# EAGLE board kicker (EAGLE 9.2.2)
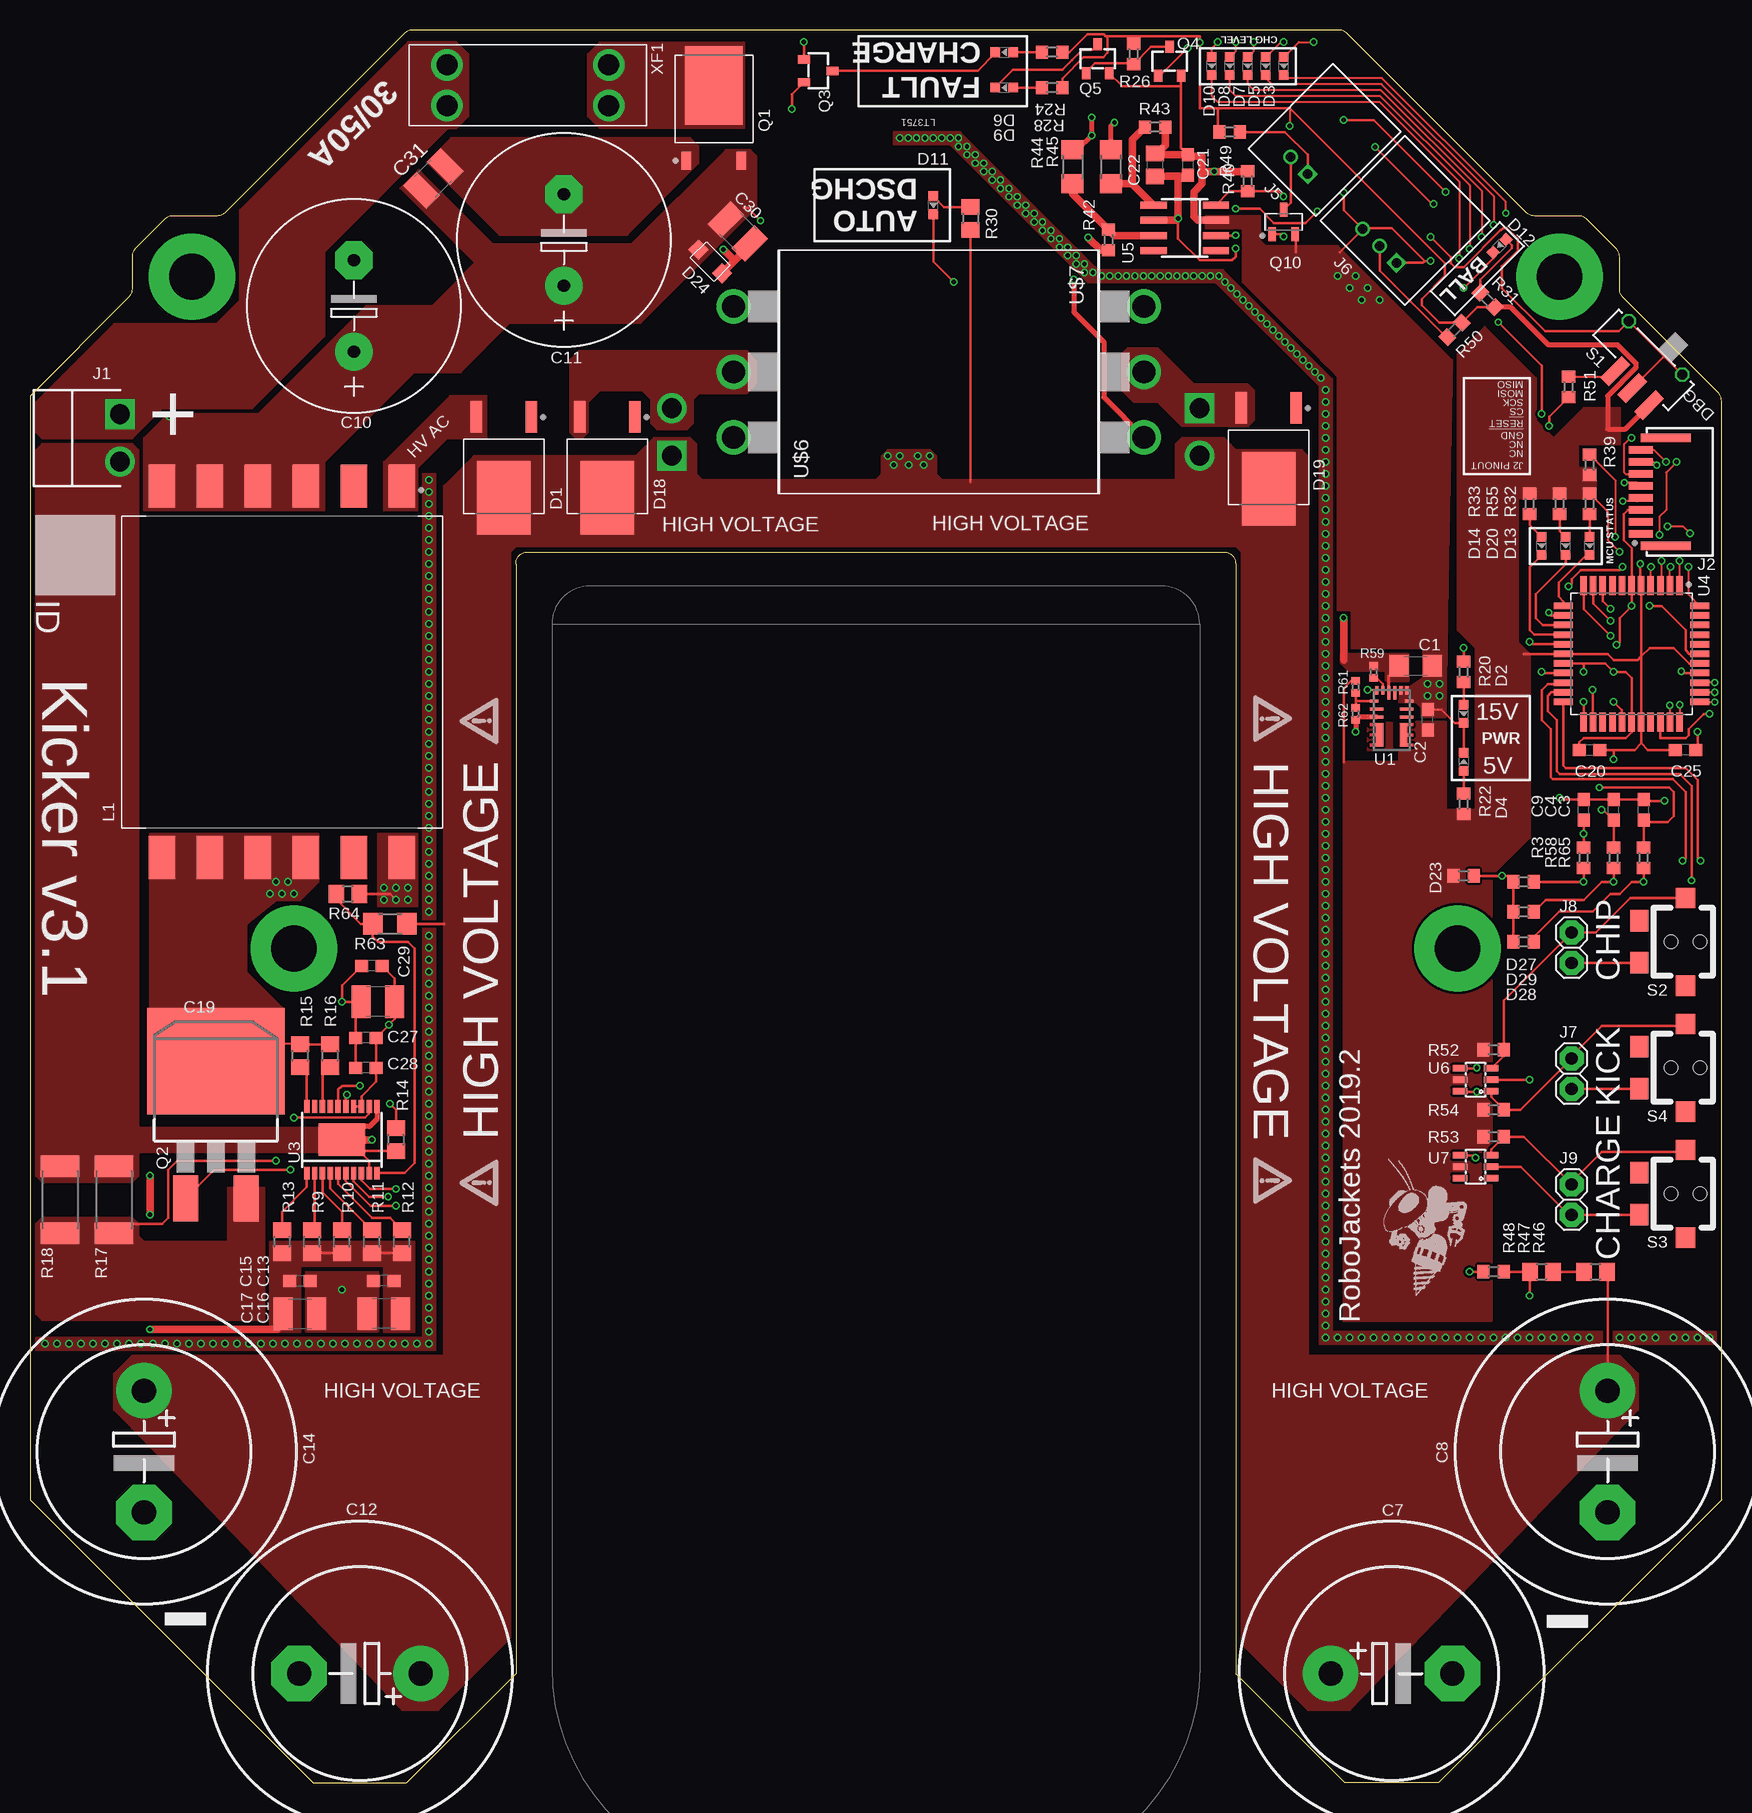
[diagram p9: board, top side]
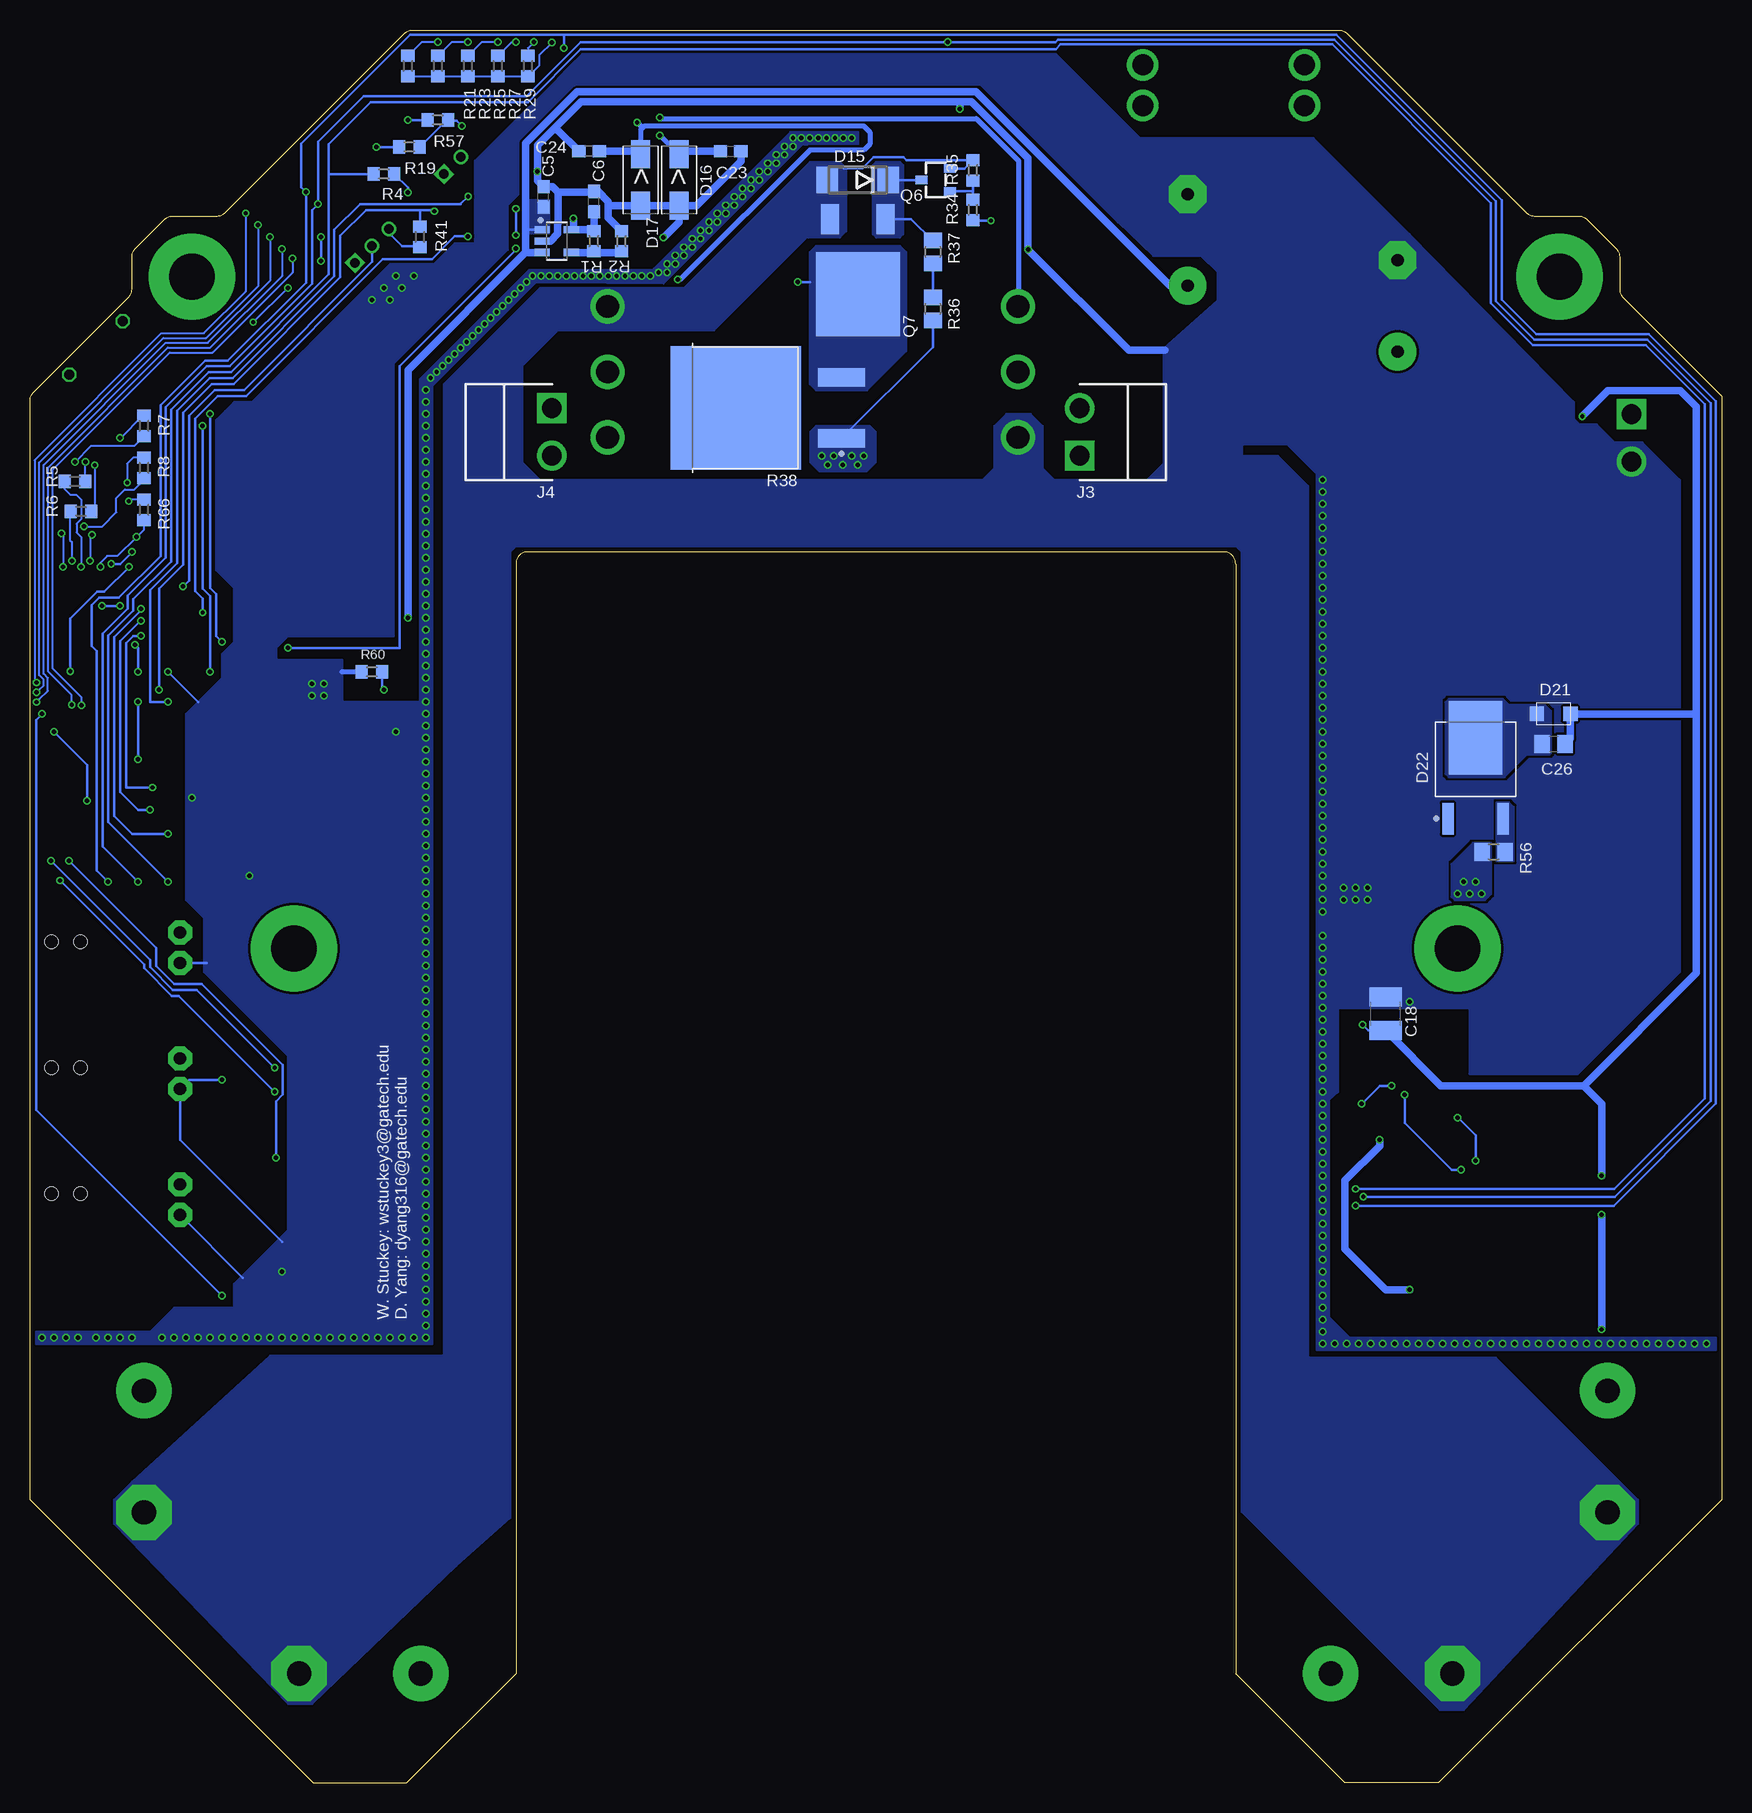
[diagram p10: board, bottom side, seen from below]

Size 141 x 146.1 mm. Coordinates in mm from the lower left corner, seen from the top.
Outline: 40.5,101.6 arc-90 41.5,102.6 99.5,102.6 arc-90 100.5,101.6 100.5,9.1 109.6,0 117.4,0 141,23.6 141,115.19 arc45 140.71,115.89 132.79,123.81 arc-45 132.5,124.51 132.5,127.19 arc45 132.21,127.89 129.79,130.31 arc45 129.09,130.6 125.41,130.6 arc-45 124.71,130.89 109.79,145.81 arc45 109.09,146.1 31.91,146.1 arc45 31.21,145.81 16.29,130.89 arc-45 15.59,130.6 11.91,130.6 arc45 11.21,130.31 8.79,127.89 arc45 8.5,127.19 8.5,124.51 arc-45 8.21,123.81 0,115.6 0,23.6 23.6,0 31.4,0 40.5,9.1 40.5,101.6
Copper layers (1*16): Top 0.018mm / dielectric 1.55mm / Bottom 0.018mm
Design rules "eC_2Layer_PClass6_BaseCopperO18_eCDefault": minimum track width 0.15mm, minimum drill 0.35mm, track to track 0.15mm, track to pad 0.15mm, pad to pad 0.15mm, via to via 0.15mm, smd to smd 0mil, copper to edge 0.25mm, drill to drill 0.35mm, minimum pad ring 0.175mm, minimum via ring 0.125mm, stop-mask expansion 0mil, vias tented up to drill 0.45mm, thermal gap 0.2mm
Net classes: 0 default: clearance 0.205 mm
vRestrict: area 18.2,65.8 to 25.8,73.3; area 115.2,65.8 to 122.8,73.3; area 9.8,121.8 to 17.2,129.3; area 123.8,121.8 to 131.2,129.3

## Footprints (pad centres in the part's own frame; a part is rotated, then mirrored left to right if it is on the bottom)
C1206 = smd 1.6 x 1.8: 1 -1.4,0; 2 1.4,0
C0603 = smd 1.1 x 1: 1 -0.85,0; 2 0.85,0
EB25D = drill 2.007 pad 4.597: + -5.08,0 | drill 2.007 pad 4.597 octagon: - 5.08,0
E7,5-18 = drill 1.016 pad 3.15: + -3.81,0 | drill 1.016 pad 3.15 octagon: - 3.81,0
C1210 = smd 1.6 x 2.7: 1 -1.4,0; 2 1.4,0
C0805 = smd 1.3 x 1.5: 1 -0.95,0; 2 0.95,0
TO460P990X239-3 = smd 2.634 x 0.974: 1 -4.241,2.3; 2 -4.241,-2.3 | smd 6.101 x 4.492: 3 2.507,0
CHIP-LED0603 = smd 0.8 x 0.8: A 0,-0.75; C 0,0.75
DO214AA = smd 1.8 x 2.2: A 2.55,0; C -2.55,0
RESM5226X262 = smd 2.316 x 1.565: 1 -2.141,0; 2 2.141,0
SOD123-W = smd 1.2 x 1.2: A 1.4,0; C -1.4,0
R0603 = smd 1 x 1.1: 1 -0.85,0; 2 0.85,0
B2PS-CENTERED = drill 1.65 square: 1 -1.98,0 | drill 1.65: 2 1.98,0
HFW8R-1ST = smd 0.6 x 2: 1 -3.5,3.25; 2 -2.5,3.25; 3 -1.5,3.25; 4 -0.5,3.25; 5 0.5,3.25; 6 1.5,3.25; 7 2.5,3.25; 8 3.5,3.25 | smd 0.7 x 4.2: LEG1 -4.5,1.15; LEG2 4.5,1.15
2MM-2-H = drill 0.8 square: 1 0,0 | drill 0.8: 2 2,0
2MM-3-H = drill 0.8 square: 1 -2,0 | drill 0.8: 2 0,0; 3 2,0
1X2 = drill 1.016 pad 2 octagon: 1 -1.27,0; 2 1.27,0
SOP400P3370X1400-12 = smd 3.562 x 2.172: 1 -15.475,10; 2 -15.475,6; 3 -15.475,2; 4 -15.475,-2; 5 -15.475,-6; 6 -15.475,-10; 7 15.475,-10; 8 15.475,-6; 9 15.475,-2; 10 15.475,2; 11 15.475,6; 12 15.475,10
TO460P950X150-3 = smd 1.512 x 0.772: 1 -4.4,2.3; 2 -4.4,-2.3 | smd 6.542 x 4.772: 3 1.885,0
D2PAK = smd 2.083 x 3.81: 1 -2.54,-8.89; 3 2.54,-8.89 | smd 11.43 x 8.89: 2 0,2.54
SOT-23-3 = smd 0.7 x 1: 1 -0.95,-1.2; 2 0.95,-1.2; 3 0,1.2
DPAK = smd 1.5 x 2.5: 1 -2.3,-6.25; 3 2.3,-6.25 | smd 7 x 7: FIN 0,0
SOT95P240X110-3 = smd 1.18 x 0.609: 1 -1.024,0.95; 2 -1.024,-0.95; 3 1.024,0
R0805 = smd 1.3 x 1.5: 1 -0.95,0; 2 0.95,0
R2512 = smd 1.8 x 3.2: 1 -2.8,0; 2 2.8,0
TO508P1539X450-3 = smd 3.912 x 1.572: 1 -6.145,2.54; 2 -6.145,-2.54 | smd 10.892 x 10.272: 3 2.655,0
R1206 = smd 1.6 x 1.803: 1 -1.422,0; 2 1.422,0
R0402 = smd 0.6 x 0.7: 1 -0.5,0; 2 0.5,0
CSS-121XB = smd 1 x 2.5: 1 -3,3.75; 2 -1,3.75; 3 1,3.75 | drill 0.8 pad 1.2 octagon: LEG1 -3.15,0; LEG4 3.15,0
HDP001R = smd 1.8 x 1.5: A -1.75,-3.85; B 1.75,-3.85 | smd 1.7 x 1.6: C -3.65,0; D 3.65,0 | hole 1.1: 0,1.2; 0,-1.2
MPM3620GQV-P = smd 0.7 x 0.25: 1 -1.45,1.55; 12 1.45,1.55 | smd 1.1 x 0.25: 2 -1.25,0.9; 3 -1.25,0.25; 10 1.25,0.25; 11 1.25,0.9 | smd 0.25 x 0.7: 13 1.25,2.45; 14 0.75,2.45; 17 -0.75,2.45; 18 -1.25,2.45 | smd 0.25 x 1.1: 15 0.25,2.25; 16 -0.25,2.25 | smd 0.6 x 1.95: 456 -1,-1.25; 789 1,-1.25
SOT95P280X145-5 = smd 1.259 x 0.609: 1 -1.228,0.95; 2 -1.228,0; 3 -1.228,-0.95; 4 1.228,-0.95; 5 1.228,0.95
TSSOP-20_EP = smd 1.05 x 0.45: 1 -2.775,2.925; 2 -2.775,2.275; 3 -2.775,1.625; 4 -2.775,0.975; 5 -2.775,0.325; 6 -2.775,-0.325; 7 -2.775,-0.975; 8 -2.775,-1.625; 9 -2.775,-2.275; 10 -2.775,-2.925; 11 2.775,-2.925; 12 2.775,-2.275; 13 2.775,-1.625; 14 2.775,-0.975; 15 2.775,-0.325; 16 2.775,0.325; 17 2.775,0.975; 18 2.775,1.625; 19 2.775,2.275; 20 2.775,2.925 | smd 2.74 x 3.86: PAD 0,0
QFP80P1200X1200X120-44 = smd 1.6 x 0.547: 1 -5.681,4; 2 -5.681,3.2; 3 -5.681,2.4; 4 -5.681,1.6; 5 -5.681,0.8; 6 -5.681,0; 7 -5.681,-0.8; 8 -5.681,-1.6; 9 -5.681,-2.4; 10 -5.681,-3.2; 11 -5.681,-4; 23 5.681,-4; 24 5.681,-3.2; 25 5.681,-2.4; 26 5.681,-1.6; 27 5.681,-0.8; 28 5.681,0; 29 5.681,0.8; 30 5.681,1.6; 31 5.681,2.4; 32 5.681,3.2; 33 5.681,4 | smd 0.547 x 1.6: 12 -4,-5.681; 13 -3.2,-5.681; 14 -2.4,-5.681; 15 -1.6,-5.681; 16 -0.8,-5.681; 17 0,-5.681; 18 0.8,-5.681; 19 1.6,-5.681; 20 2.4,-5.681; 21 3.2,-5.681; 22 4,-5.681; 34 4,5.681; 35 3.2,5.681; 36 2.4,5.681; 37 1.6,5.681; 38 0.8,5.681; 39 0,5.681; 40 -0.8,5.681; 41 -1.6,5.681; 42 -2.4,5.681; 43 -3.2,5.681; 44 -4,5.681
SOIC-8 = smd 0.6 x 2.2: 1 -1.905,-2.6; 2 -0.635,-2.6; 3 0.635,-2.6; 4 1.905,-2.6; 5 1.905,2.6; 6 0.635,2.6; 7 -0.635,2.6; 8 -1.905,2.6
SOT-23-6 = smd 0.55 x 1.2: 1 -0.95,-1.3; 2 0,-1.3; 3 0.95,-1.3; 4 0.95,1.3; 5 0,1.3; 6 -0.95,1.3
TO264 = drill 1.905: C_BOT 0,-6.35; E_BOT 5.461,-6.35; G_BOT -5.461,-6.35
3557-2 = drill 1.75: 1 -6.735,1.7; 2 -6.735,-1.7; 3 6.735,-1.7; 4 6.735,1.7

## Placement (x,y rotation side)
C1  10uF 50V  [C1206]  115.5,93.1 0 top
C2  22uF 10V  [C0603]  116.5,88.6 90 top
C3  1uF  [C0603]  134.5,81.1 90 top
C4  1uF  [C0603]  132,81.1 90 top
C5  1uF  [C0603]  98.2,132.2 90 bottom
C6  2.2uF  [C0603]  94,131.8 90 bottom
C7  1000uF  [EB25D]  113.5,9.1 0 top
C8  1000uF  [EB25D]  131.5,27.6 270 top
C9  1uF  [C0603]  129.5,81.1 90 top
C10  560uF  [E7,5-18]  27,123.1 90 top
C11  560uF  [E7,5-18]  44.5,128.6 90 top
C12  1000uF  [EB25D]  27.5,9.1 180 top
C13  0.1uF  [C0603]  29.5,41.85 180 top
C14  1000uF  [EB25D]  9.5,27.6 270 top
C15  10pF  [C0603]  22.5,41.85 0 top
C16  10uF (X7R)  [C1210]  29.5,39.1 180 top
C17  10uF (X7R)  [C1210]  22.5,39.1 0 top
C18  10uF (X7R)  [C1210]  28,64.1 90 bottom
C19  10uF (X7R)  [C1210]  29,65.1 180 top
C20  0.1uF  [C0603]  130,86.1 0 top
C21  0.1uF 35V  [C0603]  96.5,134.85 270 top
C22  22uF 35V  [C0805]  93.75,134.85 270 top
C23  0.1uF 50V  [C0603]  82.6,136 0 bottom
C24  0.1uF 50V  [C0603]  94.4,136 180 bottom
C25  0.1uF  [C0603]  138,86.1 180 top
C26  100pF 180V  [C0805]  14,86.6 0 bottom
C27  0.1uF  [C0603]  28,62.1 180 top
C28  0.1uF  [C0603]  28,59.6 180 top
C29  10pF  [C0603]  28.5,68.1 180 top
C30  10uF (X7R)  [C1210]  59,129.3 315 top
C31  10uF (X7R)  [C1210]  33.62,133.72 45 top
D1  VS-5EWH06FN-M3D-PAK_TO252AA  [TO460P990X239-3]  39.5,109.6 270 top
D2  GREEN  [CHIP-LED0603]  119.5,89.1 180 top
D3  BLUE  [CHIP-LED0603]  104.5,143.1 180 top
D4  GREEN  [CHIP-LED0603]  119.5,85.1 0 top
D5  YELLOW  [CHIP-LED0603]  103,143.1 180 top
D6  GREEN  [CHIP-LED0603]  81.2,144.25 90 top
D7  YELLOW  [CHIP-LED0603]  101.5,143.1 180 top
D8  RED  [CHIP-LED0603]  100,143.1 180 top
D9  RED  [CHIP-LED0603]  81.2,141.3 90 top
D10  RED  [CHIP-LED0603]  98.5,143.1 180 top
D11  YELLOW  [CHIP-LED0603]  75.3,131.5 180 top
D12  BLUE  [CHIP-LED0603]  122.5,128.1 135 top
D13  GREEN  [CHIP-LED0603]  130,103.1 180 top
D14  RED  [CHIP-LED0603]  126,103.1 180 top
D15  3SMBJ5929B-TP  [DO214AA]  72,133.6 180 bottom
D16  SMAJ20ADO-214AC  [RESM5226X262]  86.9,133.6 90 bottom
D17  SMAJ20ADO-214AC  [RESM5226X262]  90.1,133.6 90 bottom
D18  VS-5EWH06FN-M3D-PAK_TO252AA  [TO460P990X239-3]  48.12,109.6 270 top
D19  VS-5EWH06FN-M3D-PAK_TO252AA  [TO460P990X239-3]  103.25,110.35 270 top
D20  YELLOW  [CHIP-LED0603]  128,103.1 180 top
D21  ATV02W600-HF  [SOD123-W]  14,89.1 0 bottom
D22  VS-5EWH06FN-M3D-PAK_TO252AA  [TO460P990X239-3]  20.5,84.6 90 bottom
D23  PESD5V0C1USFYL  [R0603]  119.5,75.6 180 top
D24  PTVS20VS1UR  [SOD123-W]  56.7,126.8 315 top
D27  PESD5V0C1USFYL  [R0603]  124.5,75.1 0 top
D28  PESD5V0C1USFYL  [R0603]  124.5,70.1 0 top
D29  PESD5V0C1USFYL  [R0603]  124.5,72.6 0 top
J1  B2PS-VH(LF)(SN)  [B2PS-CENTERED]  7.5,112.1 270 top
J2  HFW8R-1ST  [HFW8R-1ST]  137.5,107.6 90 top
J3  B2PS-VH(LF)(SN)  [B2PS-CENTERED]  53.5,112.6 90 bottom
J4  B2PS-VH(LF)(SN)  [B2PS-CENTERED]  97.5,112.6 270 bottom
J5  2-PIN_2MM-H  [2MM-2-H]  106.5,134.1 135 top
J6  3-PIN_2MM-H  [2MM-3-H]  112.5,128.1 135 top
J7  !BTN_KCK_PRE_EXT  [1X2]  128.5,59.1 270 top
J8  !BTN_CHP_PRE_EXT  [1X2]  128.5,69.6 270 top
J9  !BTN_CHG_PRE_EXT  [1X2]  128.5,48.6 270 top
L1  GA34XX-BLBL  [SOP400P3370X1400-12]  21,92.6 270 top
Q1  ATP302ATPAK  [TO460P950X150-3]  57,139.6 90 top
Q2  IRFS4227  [D2PAK]  15.5,57.6 0 top
Q3  BSS127  [SOT-23-3]  65.7,142.7 270 top
Q4  BSS127  [SOT-23-3]  95,143.5 0 top
Q5  BSS127  [SOT-23-3]  89,143.7 0 top
Q6  BSS127  [SOT-23-3]  65.5,133.6 90 bottom
Q7  AOD1N60  [DPAK]  72,124.1 180 bottom
Q10  BSS806NSOT-23-3  [SOT95P240X110-3]  104.5,130.1 90 top
R1  110k 1%  [R0603]  94,128.5 90 bottom
R2  10k 1%  [R0603]  91.7,128.5 270 bottom
R3  160  [R0603]  129.5,77.1 270 top
R4  100k  [R0603]  111.5,134.1 180 bottom
R5  2.7k  [R0603]  137.25,108.47 180 bottom
R6  2.7k  [R0603]  136.75,105.97 179.7 bottom
R7  2.7k  [R0603]  131.5,113.1 270 bottom
R8  2.7k  [R0603]  131.5,109.6 270 bottom
R9  294k 1%  [R0805]  23.5,45.1 90 top
R10  412k 1%  [R0805]  26,45.1 90 top
R11  294k 1%  [R0805]  28.5,45.1 90 top
R12  412k 1%  [R0805]  31,45.1 90 top
R13  40.2k 1%  [R0805]  21,45.1 270 top
R14  1.62k 1%  [R0805]  30.5,53.6 270 top
R15  18.2k 1%  [R0805]  22.5,60.6 270 top
R16  40.2k 1%  [R0805]  25,60.6 270 top
R17  7.5m 1%  [R2512]  7,48.6 270 top
R18  7.5m 1%  [R2512]  2.5,48.6 270 top
R19  100k  [R0603]  109.38,136.35 0 bottom
R20  1k  [R0603]  119.5,92.6 90 top
R21  162  [R0603]  109.5,143.1 270 bottom
R22  162  [R0603]  119.5,81.6 270 top
R23  162  [R0603]  107,143.1 270 bottom
R24  162  [R0603]  85.2,144.25 0 top
R25  261  [R0603]  104.5,143.1 270 bottom
R26  1k  [R0603]  92,144.1 90 top
R27  261  [R0603]  102,143.1 270 bottom
R28  261  [R0603]  85.2,141.3 0 top
R29  261  [R0603]  99.5,143.1 270 bottom
R30  ERJ-P06J274V  [R0805]  78.4,130.4 270 top
R31  60  [R0603]  121.5,123.6 315 top
R32  162  [R0603]  130,106.6 90 top
R33  261  [R0603]  125,106.6 90 top
R34  270k  [R0603]  62.4,131.1 270 bottom
R35  100k  [R0603]  62.4,134.4 270 bottom
R36  ERJ-6GEYJ515V  [R0805]  65.75,122.85 270 bottom
R37  ERJ-6GEYJ515V  [R0805]  65.75,127.6 270 bottom
R38  1.5k 35W  [TO508P1539X450-3]  79.5,114.6 180 bottom
R39  10k  [R0603]  130,109.85 270 top
R40  10k  [R0603]  101.5,133.5 270 top
R41  10k  [R0603]  108.5,128.85 90 bottom
R42  10k  [R0603]  89.9,128.6 90 top
R43  10k  [R0603]  93.8,138 180 top
R44  160  [R1206]  86.9,134.7 90 top
R45  160  [R1206]  90.1,134.7 90 top
R46  ERJ-6GEYJ515V  [R0805]  130.5,42.6 0 top
R47  ERJ-6GEYJ515V  [R0805]  126,42.6 0 top
R48  RC0603FR-07205KL  [R0603]  122,42.6 0 top
R49  50  [R0603]  100,137.6 0 top
R50  10k  [R0603]  118.75,121.1 45 top
R51  10k  [R0603]  128.25,116.35 270 top
R52  10k  [R0603]  122,61.1 180 top
R53  10k  [R0603]  122,53.85 180 top
R54  10k  [R0603]  122,56.1 180 top
R55  60  [R0603]  127.5,106.6 90 top
R56  1.2  [R0805]  19,77.6 0 bottom
R57  100k  [R0603]  107,138.6 0 bottom
R58  160  [R0603]  132,77.1 270 top
R59  100k  [R0402]  112,92.6 270 top
R60  43.2k  [R0603]  112.5,92.6 0 bottom
R61  160k 1%  [R0402]  110.5,91.35 90 top
R62  30.1k 1%  [R0402]  110.5,89.1 90 top
R63  187k  [R1206]  30,71.6 180 top
R64  931  [R0805]  26.5,74.1 0 top
R65  160  [R0603]  134.5,77.1 270 top
R66  2.7k  [R0603]  131.5,106.1 270 bottom
S1  CSS-121XB  [CSS-121XB]  135.5,119.6 135 top
S2  HDP001R  [HDP001R]  138,70.1 270 top
S3  HDP001R  [HDP001R]  138,49.1 270 top
S4  HDP001R  [HDP001R]  138,59.6 270 top
U1  MPM3620GQV-P  [MPM3620GQV-P]  113.5,88.6 0 top
U2  15V  [SOT95P280X145-5]  97.1,128.5 0 bottom
U3  LT3751FE  [TSSOP-20_EP]  26,53.6 90 top
U4  AT32ATQFP44  [QFP80P1200X1200X120-44]  133.5,94.1 270 top
U5  IX4427N  [SOIC-8]  96.25,129.6 90 top
U6  MAX6817  [SOT-23-6]  120.5,58.6 90 top
U7  MAX6817  [SOT-23-6]  120.5,51.35 90 top
U$1  [WARNING2]  39,48.1 90 top
U$2  [WARNING2]  39,86.6 90 top
U$3  [WARNING2]  102,90.6 270 top
U$4  [WARNING2]  102,52.1 270 top
U$5  [ROBOBUZZ_0.6X]  115.5,40.6 0 top
U$6  IXGK400N30A3  [TO264]  86.5,117.6 90 top
U$7  IXGK400N30A3  [TO264]  65,117.6 270 top
XF1  30A  [3557-2]  41.5,141.5 0 top

## Tracks (layer width: path | path; a pad name or v marks a point on that pad's centre or on a via)
15V_PWR_BR
  Top 0.2: D2.A R20.1
!BTN_CHG  (via drill 0.35)
  Top 0.2: U4.20 127.72,91.6 126.5,91.6 126,91.1 126,88.6 126.75,87.85 126.75,83.85 126.95,83.65 136.95,83.65 138,82.6 138,77.1 v137.75,76.85 | U7.4 120.3,52.3 v120.5,52.1
  Bottom 0.2: v120.5,52.1 120.5,56.79 119.92,57.36 119.92,59.84 126.69,66.6 129,66.6 130.5,68.1 130.5,69.6 v137.75,76.85
!BTN_CHG_PRE
  Top 0.2: S3.C 137.85,52.6 131,52.6 128.5,50.1 J9.1 124.52,53.85 R53.1 121.8,52.8 U7.3
!BTN_CHP  (via drill 0.35)
  Top 0.2: U4.22 127.82,84.78 128,84.6 138,84.6 139,83.6 139,77.1 v139.25,76.85 | U6.4 120.55,59.55 v120.6,59.6
  Bottom 0.2: v120.6,59.6 127.1,66.1 129.1,66.1 131,68 131,68.6 v139.25,76.85
!BTN_CHP_PRE
  Top 0.2: S2.C 133.38,73.75 130.5,70.87 J8.1 122.85,65.22 R52.1 122.85,60.6 U6.3
!BTN_KCK  (via drill 0.35)
  Top 0.2: U4.21 126.8,90.9 126.5,90.6 126.5,89.35 127.25,88.6 127.25,84.35 127.5,84.1 137.5,84.1 138.5,83.1 v138.5,75.2 | U6.6 119.25,57.6 v120.6,57.6
  Bottom 0.2: v120.6,57.6 128.6,65.6 129.2,65.6 131.5,67.9 131.5,68.2 v138.5,75.2
!BTN_KCK_PRE
  Top 0.2: S4.C 137.85,63.1 131,63.1 128.5,60.6 J7.1 124.23,56.1 R54.1 121.8,57.15 U6.1
!DONE!  (via drill 0.35)
  Top 0.2: v131.75,96.85 130.3,98.3 U4.10 | R58.1 C4.1 131.15,81.1 v131,81.1
  Bottom 0.2: v131,81.1 132,81.1 133.5,82.6 133.5,95.17 131.82,96.85 v131.75,96.85
!DONE!_RAW  (via drill 0.35)
  Top 0.2: U3.7 26.98,50.12 28.25,48.85 v29.85,48.85 | R58.2 v132,75.1 131,75.1 129.5,73.6 126.35,73.6 D29.2 | v117,131.6 116.88,131.6 v112.12,136.35 | Q3.1 v64.5,145.1
  Bottom 0.2: R19.1 v112.12,136.35 | v29.85,48.85 8.9,48.85 0.9,56.85 0.9,115 6.2,120.3 15.6,120.3 18.81,123.51 18.81,131.84 32.27,145.3 55.33,145.3 55.52,145.1 v64.5,145.1 95.1,145.1 99.6,140.6 113.17,140.6 117,136.77 v117,131.6 117.5,131.1 117.5,124.97 124.37,118.1 126.25,118.1 129.7,114.65 129.7,102.1 132.85,98.95 132.85,97.87 134.95,95.77 134.95,78.05 v132,75.1
!FAULT!  (via drill 0.35)
  Top 0.2: v131.75,95.6 129.5,97.85 U4.11 | v130.8,82.95 136.65,82.95 137,82.6 137,80.6 136.5,80.1 134.65,80.1 C3.1 R65.1
  Bottom 0.2: v130.8,82.95 133,82.95 133,95 132.4,95.6 v131.75,95.6
!FAULT!_RAW  (via drill 0.35)
  Top 0.2: U3.6 26.33,50.15 28.38,48.1 v30.5,48.1 | Q4.1 94.18,142.3 96.48,144.6 v96.5,144.6 | R65.2 v134.5,75.1 133.5,75.1 132.5,74.1 131.74,74.1 130.25,72.62 127.48,72.62 125.35,70.49 D28.2 | v109.5,138.6 112,138.6 v118,132.6
  Bottom 0.2: v30.5,48.1 9,48.1 0.49,56.61 0.49,115.18 6.06,120.75 15.43,120.75 18.3,123.62 18.3,131.91 32.1,145.7 96.5,145.7 | v134.5,75.1 135.45,76.05 135.45,94.33 135.85,94.73 135.85,98.15 135.23,98.77 133.6,98.77 130.12,102.25 130.12,114.81 126.38,118.55 124.5,118.55 118,125.06 v118,132.6 118.38,132.98 118.38,136.62 109.3,145.7 96.5,145.7 | R57.1 v109.5,138.6 | v96.5,144.6 96.5,145.7
!KICKER_SELECT  (via drill 0.35)
  Top 0.15: U4.44 138.25,99.03 v138.25,101.35
  Top 0.152: v136.5,104.72 137.8,104.72 v138.38,104.15
  Bottom 0.152: v136.5,104.72 134.97,104.72 133.8,105.89 133.8,107.1 133.1,107.8 132.3,107.8 131.5,108.6 | 131.5,108.6 131.5,108.59 | R8.2 131.5,108.6 | v138.38,104.15 138.25,104.02 v138.25,101.35
!KICKER_SELECT_CL  (via drill 0.35)
  Top 0.152: v132.91,108.38 133.97,108.38 J2.5
  Bottom 0.152: R8.1 132.4,110.45 132.91,109.94 v132.91,108.38
!RESET  (via drill 0.35)
  Top 0.15: U4.4 135.1,101.32 v135.12,101.35 | R39.1 132.12,108.57 v132.12,103.85
  Bottom 0.15: v132.12,103.85 133.72,102.25 134.57,102.25 135.12,101.69 v135.12,101.35
  Bottom 0.152: v132.12,103.85 131.5,104.47 R66.2
!RESET_CL  (via drill 0.35)
  Top 0.152: v132.78,106.82 133.97,106.82 J2.4
  Bottom 0.152: R66.1 132.65,106.95
  Bottom 0.2: v132.78,106.82 132.65,106.95
+5V  (via drill 0.35)
  Top 0.15: R32.2 131.5,105.95 131.5,103.6 v132.5,102.6
  Top 0.152: 105,139.6 v105,138.1
  Top 0.2: 89.8,145.6 89.65,145.6 89.5,145.75 88.15,145.75 86.65,144.25 R24.2 | 89.8,145.6 92,145.6 | 92,145.6 97.5,145.6 v97.5,145.05 97.5,139.6 99,139.6 | R26.2 92,145.6 | 99,139.6 105,139.6 117.95,126.65 117.95,125.62 116,123.67 116,123.18 117.48,121.7 R50.2 120.65,123 R31.2 | 132,86.1 133.75,86.1 134.3,86.65 | 134.3,86.65 U4.29 134.3,93.9 | 134.3,93.9 135,94.6 137,94.6 138.3,93.3 U4.38 | 134.3,93.9 134,93.6 132,93.6 131.5,94.1 U4.17 124.5,94.1 | 134.3,93.9 U4.5 134.22,99.86 v134.22,101.6 | U4.27 132.7,89.4 v132,90.1 | v132,85.3 132,86.1 | R49.1 99,137.75 99,139.6 | 134.3,86.65 134.85,86.1 C25.2 | 132,86.1 C20.2 | R61.2 110.1,91.85 109.5,91.25 109.5,85.1 | 89.8,145.6 89.83,145.57 89.83,144.19 89.46,143.82 87.83,143.82 86.05,142.05 R28.2
  Top 0.406: S1.1 132.99,112.85 131.5,112.85 131.5,115.6 133.86,117.96 133.86,118.34 132.36,119.84 126.6,119.84 123.44,123 R31.2
  Bottom 0.15: R21.2 R23.2 R25.2 R27.2 R29.2 99.43,142.25 98.53,143.16 98.53,144.02 v97.5,145.05
  Bottom 0.2: v132,90.1 v132,85.3 | v132.5,102.6 133.5,101.6 v134.22,101.6 | v105,138.1 105.42,138.52 106.08,138.52 R57.2 106.28,138.6 R19.2
  pour Top (no thermals): 114.12,88.4 118,88.4 118,77.1 121.8,77.1 121.8,38.5 109.5,38.5 109.5,85.1 114.12,85.1
  pour Top (no thermals): 119,96.1 119,119.1 121.25,121.35 125.5,117.1 125.5,113.6 127,112.1 129.5,114.6 132.5,114.6 132.5,111.6 129,111.6 129,109.6 130.5,109.6 130.5,107.1 124,107.1 124,95.1 125,94.1 125,78.8 121.6,75.4 118,75.4 118,81.1 120.5,81.1 120.5,94.6
+15.0V  (via drill 0.35)
  Top 0.2: R20.2 v119.5,94.6 | v100.5,127.9 100.5,127.2 100.2,126.9 97.5,126.9 95.7,128.7 v95.7,130.4
  Top 0.61: C22.2 95.8,133.9 | 95.8,133.9 96.4,133.9 C21.2 | 95.8,133.9 95.7,133.8 v95.7,130.4 95.53,130.23 U5.6
  Bottom 0.2: v100.5,127.9 100.5,127.8 110.2,118.1 110.2,94.6 v119.5,94.6
  Bottom 0.61: v95.7,130.4 95.7,129.62 U2.5 94.1,129.45 R1.2 C6.1
BALL_SENSE  (via drill 0.35)
  Top 0.2: v126,114.1 126,118.13 v122.39,121.74 | U4.16 125.2,94.9 v125,95.1 | D12.C 121.97,127.07 v119.5,124.6
  Bottom 0.2: v126,114.1 126,99.6 125.5,99.1 125.5,95.6 v125,95.1 | v122.39,121.74 119.53,124.6 v119.5,124.6
BB_RX  (via drill 0.35)
  Top 0.2: R50.1 118.06,120.5 112.5,126.05 J6.2 | v128.25,99.72 128.5,99.97 128.5,100.35 129.25,101.1 132.5,101.1 v132.75,101.35 | U4.37 137.8,92.5 v137.65,92.65
  Bottom 0.2: J6.2 112.49,126.77 123.16,116.1 125.62,116.1 127.75,113.97 127.75,100.22 v128.25,99.72 | v137.65,92.65 137.65,97.02 135.39,99.27 134.82,99.27 v132.75,101.35
BB_TX  (via drill 0.35)
  Top 0.2: Q10.1 104.33,129.07 v104.5,128.9 | U4.13 126.83,97.3 v126.6,97.53
  Bottom 0.2: v126.6,97.53 126.6,98.7 127.25,99.35 127.25,113.72 125.38,115.6 123,115.6 111.6,127 107.5,127 105.6,128.9 v104.5,128.9
BB_TX_CL
  Top 0.2: J5.1 106.5,135.7 104.6,137.6 R49.2
CHARGE  (via drill 0.35)
  Top 0.2: U4.9 131.1,98.5 v131.75,97.85 | C9.1 v129.5,79.1 R3.1
  Bottom 0.2: v129.5,79.1 132.5,79.1 134,80.6 134,95.5 131.75,97.75 v131.75,97.85
CHARGE_RAW  (via drill 0.35)
  Top 0.2: U3.8 27.62,50.22 28.35,49.5 v30.5,49.5 | R3.2 v129.5,75.1 D27.2
  Bottom 0.2: v30.5,49.5 8.95,49.5 1.4,57.05 1.4,114.9 6.33,119.82 15.73,119.82 19.22,123.31 19.22,131.67 32.44,144.89 55.11,144.89 55.5,144.5 64.14,144.5 64.15,144.5 64.95,144.5 64.96,144.5 95.1,144.5 99.5,140.1 112.6,140.1 116.1,136.6 116.1,134.1 | 116.1,134.1 116.1,125.75 124.25,117.6 126.12,117.6 129.25,114.47 129.25,101.8 132.4,98.65 132.4,97.72 134.5,95.62 134.5,80.1 v129.5,75.1 | 116.1,134.1 R4.2
CHIP  (via drill 0.35)
  Top 0.2: v100.5,129 100.47,128.97 U5.2 | v130.25,91.1 130.25,88.47 U4.24 | v100.5,131.19 102.5,131.19 103.7,130 106.31,130 v107.3,131
  Bottom 0.2: 108.5,131.1 113,131.1 115.14,128.96 115.14,125.49 124.03,116.6 125.88,116.6 128.25,114.22 128.25,101.55 130.25,99.55 v130.25,91.1 | R41.2 108.5,131.1 | v100.5,131.19 v100.5,129 | v107.3,131 107.41,131.1 108.5,131.1
CHIP_GATE
  Top 0.61: U5.7 90.39,128.97 R42.2 86.9,132.45 R44.1
CHIP_GATE_S  (via drill 0.35)
  Top 0.406: R44.2 87.32,136.12 v88.5,137.3 v88.5,138.81
  Bottom 0.406: U$7.G_BOT 58.6,123.11 58.6,135.2 62.11,138.71 88.4,138.71 v88.5,138.81 | D16.2 88.46,137.3 v88.5,137.3
  Bottom 0.61: C23.1 86.64,136 D16.2
CHIPPER
  pour Top (no thermals): 45,112.6 45.5,112.1 46,112.1 46.5,112.6 46.5,115.1 47.5,116.1 51,116.1 51.75,115.35 51.75,113.35 52.25,112.85 54.75,112.85 55.25,113.35 55.25,115.35 55.75,115.85 59.75,115.85 60.5,116.6 60.5,118.6 59.75,119.35 45.75,119.35 45,118.6
CSP  (via drill 0.38)
  Top 0.2: U3.12 28.23,56.32 28.23,55.75 27.95,55.47 22,55.47 v22,55.45 | v20.5,51.85 12.25,51.85 11.5,51.1 11.5,47.1 11,46.6 7.8,46.6 R17.2
  Bottom 0.2: v22,55.45 20.5,53.95 v20.5,51.85
  pour Top (no thermals): 16.5,49.6 16.5,45.1 12.5,45.1 12.5,38.6 19.5,38.6 19.5,49.6
  pour Top (no thermals): 9,46.6 8.5,47.1 1,47.1 0.5,46.6 0.5,39.1 1,38.6 13,38.6 13,45.1 9.5,45.1 9,45.6
DISCHARGE_DRAIN  (via drill 0.35)
  Top 0.2: D11.C 75.3,126.8 v77,125.1
  Bottom 0.2: v77,125.1 76,125.1
  pour Bottom (no thermals): 68,127.6 68.5,128.1 75.5,128.1 76,127.6 76,116.6 75.5,116.1 71.5,116.1 71.25,116.1 68,119.35
FAULT_INV_BR
  Top 0.2: Q5.1 88.05,142.65 88.75,143.35 91.9,143.35 R26.1 93.45,144.7 Q4.3
FB
  Top 0.2: R61.1 110.5,90.1 | 110.5,90.1 R62.2 | 110.5,90.1 110.55,90.15 U1.1
GND  (via drill 0.35, 0.38)
  Top 0.2: 26.75,53.85 26.65,53.75 26.5,53.6 | R14.2 27.55,52.65 27.5,52.6 | Q4.2 95.95,141.4 | 95.95,141.4 95.95,136.25 C21.1 | S3.B 134.13,47.33 J9.2 128.27,47.33 124.25,51.35 U7.2 | S4.B 128.52,57.85 J7.2 | S2.B 134.13,68.33 J8.2 | 136.25,118.85 S1.LEG4 132.44,121 126.3,121 122.7,124.6 122.7,126.4 124,127.7 124,128.7 123.1,129.6 122.8,129.6 122.6,129.4 122.58,129.4 119.53,126.35 118.77,126.35 118.45,126.67 118.45,127.15 v116.75,128.85 | 136.25,118.85 S1.LEG1 | S1.2 136.16,118.85 136.25,118.85 | D4.C D2.C | v116.75,126.85 116.25,126.85 | 116.25,126.85 113.5,129.6 111.17,129.6 J6.3 109.17,127.6 | J6.1 116.09,126.69 116.25,126.85 | J2.3 133.19,106.1 132.85,105.76 132.85,103.56 133.5,102.91 U4.6 v133.5,98.1 132.5,97.1 132.5,95.1 v132.25,94.85 | U4.18 129.5,93.3 | 129.5,93.3 131.3,93.3 v132,92.6 133,92.6 133.5,92.1 U4.28 133.5,87.6 133,87.1 129.5,87.1 129.15,86.75 C20.1 | v129.5,92.6 129.5,93.3 | U6.2 v125,58.6 | R48.1 v120,42.6 | Q10.2 105.5,129.02 105.5,127.6 | C25.1 139,86.25 v139,87.6 | v135,98.1 136,98.1 138,96.1 138,94.4 138.3,94.1 U4.39 | 28,74.1 R64.2 30,74.1 v30.5,73.6 | C28.2 C27.2 27.15,64.65 C19.2 v26,65.1 26,66.45 C29.2 | v136.25,81.85 134.6,81.85 C3.2 C4.2 C9.2 127.65,81.95 v127.5,82.1 | D23.1 v122.7,75.6 123.15,75.6 D27.1 D29.1 D28.1 | Q5.2 91.05,141.4 95.95,141.4 | Q3.2 63.5,140.75 v63.5,139.52 | 101.45,134.3 R40.1
  Top 0.203: U3.9 28.27,51.82 27.5,52.6 26.5,53.6 | D2.C 118.75,88.35 117.65,89.45 C2.2 | v109.5,132.55 109.5,131.1 J6.3
  Top 0.406: v110.5,87.6 R62.1 110.75,88.85 U1.3 | U3.11 28.92,55.32 28.3,54.7 27.8,54.7 27.5,54.4 27.5,53.6 26.5,53.6 U3.PAD 26.15,53.75 26.65,53.75
  Top 0.61: 26.75,53.85 27,53.6 27.5,53.6 v28.5,53.6 | C22.1 93.85,135.7 | 93.85,135.7 C21.1 96.6,135.6 97.7,135.6 97.7,134.4 | U5.3 97.36,130.23 97,130.6 97,132.6 97.7,133.3 97.7,134.4 | 97.7,134.4 97.8,134.3 v98.7,134.3 101.45,134.3 | R42.1 89.25,127.75 v88.2,128.8 | R43.1 94.65,136.5 93.85,135.7 | D24.A 58.74,126.86 | 58.74,126.86 59.99,128.11 C30.2 | 58.74,126.86 v57.8,127.8
  Bottom 0.2: R41.1 108.6,128.1 110,128.1 111.09,129.19 J6.3 | v116.75,126.85 v116.75,128.85 | v133.5,98.1 v135,98.1 | v129.5,92.6 127,90.1 | J9.2 123.27,42.1 | 120,45.1 128.5,53.6 J7.2 127.73,58.6 v125,58.6 | J8.2 126.27,68.33 | v132.25,94.85 132,94.6 v132,92.6 | v136.25,81.85 136.25,84.85 v139,87.6 | Q6.2 63.1,134.55 R35.1 67.95,135.25 68.2,135.5 70.7,135.5 71.6,134.6 73.2,134.6
  Bottom 0.203: R4.1 109.5,132.95 v109.5,132.55
  Bottom 0.406: R60.1 115,92.6
  Bottom 0.61: v28.5,53.6 28.5,53.1 31.4,50.2 31.4,44.5 28,41.1 v26,41.1 | 97,132.6 97,129.98 97.01,129.97 97.01,129.11 97.62,128.5 U2.2 | 97,132.6 97.45,133.05 C5.2 98.7,133.55 v98.7,134.3 98.7,136.5 97.4,137.8 | R2.1 92.8,130.45 92.8,131.4 | 92.8,131.4 92.8,131.8 93.65,132.65 C6.2 94.05,132.6 97,132.6 | C23.2 81.75,135.15 85.44,131.46 D16.1 | D16.1 D17.1 92.74,131.46 92.8,131.4 | D16.1 86.9,130.1 v88.2,128.8 | C24.2 97.05,137.8 97.4,137.8 | 46.4,119.4 49.4,119.4 v57.8,127.8 57.8,135.41 62.52,140.13 63.5,140.13 | 97.4,137.8 95.07,140.13 63.5,140.13 | v63.5,139.52 63.5,140.13
  other vias: 31.25,36.6 32.25,36.6 33.25,36.6 33.25,37.6 33.25,38.6 29.5,74.6 30.5,74.6 31.5,74.6 31.5,73.6 29.5,73.6 138,37.1 132.5,37.1 133.5,37.1 140,37.1 137,37.1 139,37.1 135.5,37.1 134.5,37.1 108,37.1 109,37.1 110,37.1 111,37.1 112,37.1 113,37.1 114,37.1 115,37.1 116,37.1 117,37.1 118,37.1 119,37.1 120,37.1 121,37.1 122,37.1 123,37.1 124,37.1 125,37.1 126,37.1 127,37.1 128,37.1 129,37.1 130,37.1 108,38.1 108,39.1 108,40.1 108,41.1 108,42.1 108,43.1 108,44.1 108,45.1 108,46.1 108,47.1 108,48.1 108,49.1 108,50.1 108,51.1 108,52.1 108,53.1 108,54.1 108,55.1 108,56.1 108,57.1 108,58.1 108,59.1 108,60.1 108,61.1 108,62.1 108,63.1 108,64.1 108,65.1 108,66.1 108,67.1 108,68.1 108,69.1 108,70.1 108,71.1 108,72.1 108,73.1 108,74.1 108,75.1 108,76.1 108,77.1 108,78.1 108,79.1 108,80.1 108,81.1 108,82.1 108,83.1 108,84.1 108,85.1 108,86.1 108,87.1 108,88.1 108,89.1 108,90.1 108,91.1 108,92.1 108,93.1 108,94.1 108,95.1 108,96.1 108,97.1 108,98.1 108,99.1 108,100.1 108,101.1 108,102.1 108,103.1 108,104.1 108,105.1 108,106.1 108,107.1 108,112.1 108,111.1 108,110.1 108,109.1 108,108.1 108,113.1 108,114.1 108,115.1 108,116.1 107.6,117.1 107.1,117.6 106.6,118.1 106.1,118.6 105.6,119.1 105.1,119.6 104.6,120.1 104.1,120.6 103.6,121.1 103.1,121.6 102.6,122.1 101.6,123.1 101.1,123.6 100.6,124.1 102.1,122.6 99.1,125.6 99.6,125.1 100.1,124.6 75.3,137.1 74.6,137.1 73.9,137.1 73.2,137.1 72.5,137.1 33.25,39.6 33.25,40.6 33.25,41.6 33.25,42.6 33.25,43.6 33.25,44.6 33.25,45.6 33.25,46.6 33.25,47.6 33.25,48.6 33.25,49.6 33.25,50.6 33.25,51.6 33.25,52.6 33.25,53.6 33.25,54.6 33.25,55.6 33.25,56.6 33.25,57.6 33.25,58.6 33.25,59.6 33.25,60.6 33.25,61.6 33.25,62.6 33.25,63.6 33.25,64.6 33.25,65.6 33.25,66.6 33.25,67.6 33.25,68.6 33.25,70.6 33.25,72.6 33.25,73.6 33.25,74.6 33.25,75.6 33.25,76.6 33.25,77.6 33.25,78.6 33.25,79.6 33.25,80.6 33.25,81.6 33.25,82.6 33.25,83.6 33.25,84.6 33.25,85.6 33.25,86.6 33.25,87.6 33.25,88.6 33.25,89.6 33.25,90.6 33.25,91.6 33.25,92.6 33.25,93.6 33.25,94.6 33.25,95.6 33.25,96.6 33.25,97.6 33.25,98.6 33.25,99.6 33.25,100.6 33.25,101.6 33.25,102.6 33.25,103.6 33.25,104.6 33.25,105.6 33.25,106.6 33.25,107.6 33.25,108.6 30.25,36.6 29.25,36.6 28.25,36.6 27.25,36.6 26.25,36.6 25.25,36.6 24.25,36.6 23.25,36.6 22.25,36.6 21.25,36.6 20.25,36.6 19.25,36.6 18.25,36.6 17.25,36.6 16.25,36.6 15.25,36.6 14.25,36.6 13.25,36.6 12.25,36.6 11.25,36.6 10.25,36.6 9.25,36.6 8.25,36.6 7.25,36.6 6.25,36.6 5.25,36.6 4.25,36.6 3.25,36.6 2.25,36.6 1.25,36.6 109,125.6 110.5,125.6 110,124.6 111.5,124.6 111,123.6 112.5,123.6 87.9,125.9 89.3,125.6 90,125.6 95.6,125.6 94.9,125.6 94.2,125.6 90.7,125.6 91.4,125.6 93.5,125.6 92.8,125.6 92.1,125.6 116.5,91.6 117.5,91.6 117.5,90.6 116.5,90.6 33.25,69.6 87.2,127.3 86.5,127.3 85.8,128 85.1,128.7 84.4,129.4 83.7,130.1 83,130.8 82.3,131.5 81.6,132.2 80.2,133.6 79.5,134.3 78.8,135 78.1,135.7 77.4,136.4 78.1,136.4 78.8,135.7 79.5,135 80.2,134.3 80.9,133.6 82.3,132.2 83,131.5 83.7,130.8 84.4,130.1 86.5,128 85.8,128.7 85.1,129.4 76,137.1 76.7,137.1 77.4,137.1 80.9,132.9 81.6,132.9 87.2,126.6 87.9,126.6 88.6,125.9 96.3,125.6 97,125.6 97.7,125.6 98.4,125.6
  pour Top (no thermals): 0.5,111.1 0.5,50.6 1,50.1 8.5,50.1 9,50.6 9,52.6 24.5,52.6 24.5,54.6 9,54.6 9,111.1 8.5,111.6 1,111.6
  pour Top (no thermals): 0.5,37.1 0.5,36.1 33.75,36.1 33.75,37.1
  pour Top (no thermals): 33.75,36.1 33.75,109.1 32.75,109.1 32.75,36.1
  pour Bottom (rank 2, no thermals): 3.5,67.6 3.5,108.6 6.6,111.7 8.9,111.7 10.4,113.2 11.8,113.2 12.3,113.7 12.3,115.1 26.01,129.1 34.01,137.1 50.3,137.1 50.3,130.11 47.34,127.3 43.4,127.3 42,125.9 42,123.6 46.5,119.6 46.5,110 47.9,108.6 55.62,108.6 56.62,109.6 56.62,113.1 57.62,114.1 59.62,114.1 60.62,113.1 60.62,109.6 61.62,108.6 98.5,108.6 100,110.1 100,118.1 97,121.1 84,121.1 76.25,128.85 73.5,128.85 73,129.35 73,134.6 73.5,135.1 76,135.1 86.5,124.6 98.5,124.6 106.5,116.6 106.5,35.6 121,35.6 132.5,25.1 134,23.6 134,21.6 119.5,6.6 117.5,6.6 105.5,18.1 101,22.1 101,102.6 100.5,103.1 40.5,103.1 40,102.6 40,22.6 23.5,6.1 21.5,6.1 7,21.6 7,23.6 18.8,35.4 34.5,35.4 34.5,108.1 37,110.6 40,110.6 40,111.6 36.25,111.6 33.75,109.1 33.75,36.1 0.5,36.1 0.5,37.1 31,37.1 32.75,38.85 32.75,56.9 32,57.6 32,64.6 21,64.6 21,59.1 12,59.1
  pour Top (no thermals): 35.1,137.1 55,137.1 55.7,136.4 55.7,135 49.75,129.05 39.15,129.05 33.1,135.1
  pour Top (no thermals): 29,79.1 29,73.1 32.25,73.1 32.25,79.1
  pour Top (no thermals): 109,117.2 109,97.73 110.2,97.73 110.2,94.6 116.12,94.6 116.12,92.1 115,91.35 114.12,91.35 114.12,90.1 115.5,90.1 116,89.6 116,88.85 117.99,88.85 118.12,99.98 118.5,118.6 109,128.1 103,128.1 102.5,128.6 102.5,130.6 98,130.6 98,129.6 101.1,129.6 101.1,125.1
  pour Bottom (no thermals): 108.5,90.1 108.5,117 99.4,126.1 89,126.1 89,126.2 77.6,137.6 72,137.6 72,136.6 76.6,136.6 88.2,125 97.75,125.1 98.8,125.1 107.5,116.4 107.5,36.6 140.5,36.6 140.5,37.6 131,37.6 129,39.6 124,39.6 124,41.6 119.5,46.1 119.5,60.6 126.5,67.6 126.5,72.1 128,73.6 128,89.1 125,92.1 125,94.1 124,95.1 124,99.6 125.5,101.1 125.5,113.6 124,115.1 122.5,115.1 111,126.6 107.3,126.6 105.6,128.3 103.9,128.3 103.9,135.2 95,144.1 55.5,144.1 46.1,134.7 46.1,130.1 50.3,130.1 61.8,141.6 95.5,141.6 100.2,136.9 100.2,132.5 101.2,131.5 101.2,127.8 110.7,118.3 110.7,95.6 119.5,95.6 120.5,94.6 120.5,93.6 115,93.6 115,90.1
  pour Top (no thermals): 132,36.6 132,37.6 140.5,37.6 140.5,36.6
  pour Top (no thermals): 89,126.1 77.5,137.6 72,137.6 72,136.6 76.7,136.6 88.2,125.1 98.8,125.1 107.5,116.4 107.5,36.6 131,36.6 131,37.6 108.5,37.6 108.5,117 99.43,126.07 98.03,126.07
  pour Top (no thermals): 23,42.6 29,42.6 29,37.6 23,37.6
HOLE1  (via drill 3.8 pad 7.2)
  other vias: 13.5,125.54
HOLE2  (via drill 3.8 pad 7.2)
  other vias: 127.5,125.54
HOLE3  (via drill 3.8 pad 7.2)
  other vias: 22,69.54
HOLE4  (via drill 3.8 pad 7.2)
  other vias: 119,69.54
HV_AC
  pour Top (no thermals): 29.5,106.1 32.25,106.1 32.25,109.6 34.75,112.1 38,112.1 38,115.6 35,115.6 29.5,110.1
HV_FB
  Top 0.2: R64.1 25.55,73.63 27.58,71.6 R63.2 28.58,70.52 29,70.1 31.5,70.1 32.05,69.55 32.05,51.65 31.23,50.82 U3.10
HV_IND_HIGH  (via drill 0.35)
  Top 0.15: v137.53,89.85 137.5,89.82 U4.33 | v120,127.85 120,133.15 112.55,140.6 100.5,140.6 100,141.1 D8.C
  Bottom 0.15: v137.53,89.85 137.53,90.66 139.5,92.63 139.5,109.63 129.51,119.62 125.97,119.62 120,125.6 v120,127.85
HV_IND_LOW  (via drill 0.35)
  Top 0.15: v122,129.85 122,132.25 112.65,141.6 103.5,141.6 103,142.1 D5.C
  Top 0.152: U4.35 v140.44,90.9 v140.45,90.89
  Bottom 0.15: v122,129.85 122,124.73 126.32,120.41 129.88,120.41 140.25,110.05 140.25,96.15
  Bottom 0.152: v140.45,90.89 140.23,91.12 140.21,91.12 139.87,91.46 139.87,91.94 140.25,92.32 140.25,96.15
HV_IND_MAX  (via drill 0.35)
  Top 0.15: v136.7,89.8 U4.32 | v119.12,127.05 119.12,133.47 112.5,140.1 99,140.1 98.5,140.6 D10.C
  Bottom 0.15: v136.7,89.8 136.7,90.46 139.12,92.88 139.12,109.44 129.34,119.22 125.78,119.22 119.12,125.88 v119.12,127.05
HV_IND_MID  (via drill 0.35)
  Top 0.15: v121,128.85 121,132.7 112.6,141.1 102,141.1 101.5,141.6 D7.C
  Top 0.152: U4.34 v140.44,90.1 v140.45,90.09
  Bottom 0.15: 139.88,96.34 139.88,109.83 129.68,120.02 126.17,120.02 121,125.2 v121,128.85
  Bottom 0.152: v140.45,90.09 140.23,90.31 140.21,90.31 139.51,91.01 139.51,92.09 139.88,92.45 139.88,96.34
HV_IND_MIN  (via drill 0.35)
  Top 0.15: v123.03,130.83 123.03,131.77 112.7,142.1 104.75,142.1 D3.C
  Top 0.152: v140.45,91.7 U4.36
  Bottom 0.15: v123.03,130.83 123.03,124.3 126.52,120.81 130.05,120.81 140.62,110.24 140.62,91.72
  Bottom 0.152: 140.62,91.72 140.6,91.7 v140.45,91.7
HV_SENSE_DIV_BR
  Top 0.2: R46.1 R47.2
HVGATE  (via drill 0.38)
  Top 0.2: Q2.1 15.35,51.1 v21.7,51.1 | U3.15 26.32,57.27 v26.4,57.35
  Bottom 0.2: v26.4,57.35 26.4,55 22.5,51.1 v21.7,51.1
KICK  (via drill 0.35)
  Top 0.2: 98.94,131.6 U5.4 100,132.65 R40.2 104.05,132.65 v104.48,132.22 | v129.5,90.1 U4.23
  Bottom 0.2: 105.1,131.6 113.5,131.6 115.64,129.46 115.64,125.56 124.1,117.1 126.03,117.1 128.75,114.38 128.75,101.65 131,99.4 131,90.1 v129.5,90.1 | v104.48,132.22 105.1,131.6 | 105.1,131.6
KICK_GATE
  Top 0.61: U5.5 91.9,133.25 | R43.2 91.9,136.95 91.9,133.25 | R45.1 91.88,133.28 91.9,133.25
KICK_GATE_S  (via drill 0.35)
  Top 0.406: v87,125.3 87,122.6 89.5,120.1 89.5,115.49 U$6.G_BOT | R45.2 90.1,138.1 v90.4,138.4
  Bottom 0.406: v87,125.3 86.8,125.3 76,136.1 71.5,136.1 71,136.6 71,137.6 71.5,138.1 89.8,138.1 89.95,137.95 | 89.95,137.95 90.1,137.8 D17.2 | v90.4,138.4 89.95,137.95
  Bottom 0.61: C24.1 90.36,136 D17.2
KICKER
  pour Top (no thermals): 96,113.1 94,115.1 92,115.1 91,116.1 91,117.6 91,119.1 91.5,119.6 94,119.6 97,116.6 101.5,116.6 102,116.1 102,113.6 101.5,113.1
MCU_ERR
  Top 0.2: U4.15 125.4,95.7 125,96.1 125,101.35 D14.C
MCU_INIT_OK
  Top 0.2: U4.12 127.82,98.47 127.42,98.86 127.42,100.05 129.72,102.35 D13.C
MCU_MODE
  Top 0.2: U4.14 126.1,96.5 125.5,97.1 125.5,99.1 128,101.6 D20.C
MISO  (via drill 0.35)
  Top 0.15: U4.2 136.7,101.12
  Top 0.152: 136.7,101.12 136.7,101.3 v136.75,101.35
  Bottom 0.152: v136.75,101.35 136.75,103.85 137.12,104.22 137.12,104.95 136.75,105.32 136.75,106.97 137.12,107.35 137.62,107.35 138.1,107.82 R5.2
MISO_CL  (via drill 0.35)
  Top 0.152: v136.38,110.1 135.38,111.1 J2.8
  Bottom 0.152: R5.1 136.4,110.07 v136.38,110.1
MODE_SELECT  (via drill 0.35)
  Top 0.2: R51.2 126.62,113.88 v126.62,113.1 | v126,92.6 126.1,92.5 U4.19
  Bottom 0.2: v126.62,113.1 126.62,99.54 126,98.91 v126,92.6
MOSI  (via drill 0.35)
  Top 0.152: U4.1 v137.5,101.85
  Bottom 0.152: v137.5,101.85 137.5,103.42 137.67,103.59 137.67,105.91 R6.2
MOSI_CL  (via drill 0.35)
  Top 0.152: v135.59,109.82 135.31,110.1 J2.7
  Bottom 0.152: R6.1 135.59,106.28 v135.59,109.82
N$1  (via drill 0.38)
  Top 0.2: R14.1 30.5,56.1 v30,56.6 | v27.5,58.1 26,58.1 25.67,57.77 U3.16
  Bottom 0.2: v30,56.6 28.5,58.1 v27.5,58.1
N$3
  Top 0.2: R33.1 125,104.85 D14.A
N$4
  Top 0.2: R32.1 D13.A
N$5
  Top 0.2: R24.1 D6.A
N$9
  pour Top (no thermals): 46.5,144.1 47.5,145.1 59.5,145.1 59.5,137.9 47.5,137.9 46.5,138.9
N$11  (via drill 0.35)
  Top 0.15: D3.A 105.75,145.1 v107,145.1
  Bottom 0.15: v107,145.1 108.35,145.1 R21.1
N$12  (via drill 0.35)
  Top 0.15: D5.A 104.25,145.1 v104.5,145.1
  Bottom 0.15: v104.5,145.1 105.85,145.1 R23.1
N$13  (via drill 0.35)
  Top 0.15: D7.A 102,144.35 v102,145.1
  Bottom 0.15: v102,145.1 103.35,145.1 R25.1
N$14
  Top 0.15: R51.1 131.69,117.2 S1.3
N$16
  Bottom 0.61: R1.1 94.1,127.55 U2.4 91.8,127.55 R2.2
N$17
  Top 0.2: R55.1 127.5,104.35 D20.A
N$18
  pour Bottom (no thermals): 18.75,76.85 18.75,81.72 17.75,81.72 17.38,81.35 17.38,76.85
N$19
  Top 0.2: J5.2 105.09,131.71 Q10.3
N$20
  Top 0.2: R22.1 D4.A
N$21  (via drill 0.35)
  Top 0.15: D8.A 100.5,144.35 v100.5,145.1
  Bottom 0.15: v100.5,145.1 100.85,145.1 R27.1
N$23
  pour Bottom (no thermals): 14.25,85.85 14.25,89.35 14.75,89.85 17.75,89.85 18.25,90.35 22.75,90.35 23,90.1 23,84.1 22.75,83.85 18.25,83.85 18.12,83.85 16.25,85.72 14.38,85.72
N$24
  Top 0.2: R13.1 21,47.6 23.08,49.67 U3.1
N$27
  Top 0.2: R28.1 D9.A
N$28
  Top 0.2: Q5.3 88.56,144.46 87.72,144.46 86.86,143.58 86.86,143.57 86.08,142.8 81.95,142.8 D9.C
N$29
  Top 0.2: R30.1 76.2,131.35 D11.A
N$30  (via drill 0.35)
  Top 0.15: D10.A 98.5,144.6 v99,145.1
  Bottom 0.15: v99,145.1 99.5,144.6 R29.1
N$37
  Top 0.2: D6.C 80.45,144.15 79,142.7 Q3.3
N$39
  pour Top (no thermals): 0.5,112.6 1,112.1 8.5,112.1 11,114.6 18.5,114.6 24.5,120.6 24.5,127.6 34.8,137.9 35.5,137.9 36.5,138.9 36.5,144.1 35.5,145.1 31.5,145.1 17.5,131.1 17.5,123.6 15.5,121.6 7,121.6 0.5,115.1
N$40
  Top 0.2: R31.1 120.9,125.3 123.5,127.9 123.5,128.16 D12.A
OVLO1
  Top 0.2: R10.2 26,47.6 24.38,49.22 U3.3
OVLO2
  Top 0.2: U3.5 25.67,49.92 28.5,47.1 30,47.1 31,46.1 R12.2
QD_GATE_CTRL
  Bottom 0.2: 64.25,132.6 Q6.1 62.45,132.65 62.4,132.6 | R34.1 62.4,132.6 | 62.4,132.6 R35.2
QD_PU_BR
  Bottom 0.2: R36.1 R37.2
QUICK_DISCHARGE
  Bottom 0.2: R37.1 67.55,130.35 Q7.1 | Q6.3 68.5,133.6
  pour Bottom (no thermals): 68.5,135.1 70.5,135.1 70.75,134.85 70.75,129.1 70.5,128.85 68.5,128.85 68.25,129.1 68.25,134.85
RDCM
  Top 0.2: R15.2 23.08,59.07 U3.20
REG-SW
  pour Top (no thermals): 111.5,88.35 111.5,86.1 113.5,86.1 113.5,88.35
REG_AAM  (via drill 0.35)
  Top 0.203: U1.18 112.2,91.1 v111.5,91.1
  Bottom 0.203: v111.5,91.1 111.65,91.25 R60.2
REG_EN
  Top 0.2: U1.17 112.75,91.6 112.25,92.1 R59.2
  Top 0.203: 112.03,92.1 R59.2
RVOUT
  Top 0.2: U3.18 24.38,59.02 R16.2
SCK  (via drill 0.35)
  Top 0.15: U4.3 136,99.88 v136,101.85
  Top 0.152: v137.25,110.1 136.38,109.22 136.38,106.09 135.82,105.54 v135.82,104.02
  Bottom 0.152: R7.2 132.32,111.43 135.92,111.43 v137.24,110.1 v137.25,110.1 | v135.82,104.02 136,103.85 v136,101.85
SCK_CL  (via drill 0.35)
  Top 0.152: J2.6 133,109.1 132.88,109.22 132.88,111.6 133.38,112.1 v133.5,112.1
  Bottom 0.152: R7.1 131.6,113.95 133.45,112.1 v133.5,112.1
UVLO1
  Top 0.2: R9.2 23.73,46.27 U3.2
UVLO2
  Top 0.2: U3.4 25.02,49.52 R11.2
V+  (via drill 0.35)
  Top 0.2: R46.2 131.5,42.55 C8.+ | R30.2 78.4,108.4 | R63.1 34.5,71.6
  Bottom 0.2: R38.1 65.75,119.66 R36.2
  other vias: 71.5,110.6 72,109.85 72.5,110.6 73.25,109.85 74,110.6 74.5,109.85 75,110.6
  pour Top (no thermals): 7,34.1 8.5,35.6 40,35.6 40,30.1 35.5,26.1 35.5,7.6 34,6.1 31,6.1 8.5,30.1 7,31.1
  pour Top (no thermals): 50.5,110.6 37,110.6 34.5,108.1 34.5,35.6 40,35.6 40,102.6 40.5,103.1 100.5,103.1 101,102.6 101,11.6 106.5,6.1 110,6.1 134,31.1 134,34.1 132.5,35.6 106.5,35.6 106.5,110.6 106,111.1 100.5,111.1 99.5,112.1 96,112.1 95.5,111.6 95.5,108.6 76,108.6 75.5,109.1 75.5,110.6 75,111.1 71.5,111.1 71,110.6 71,109.1 70.5,108.6 56,108.6 55.5,109.1 55.5,111.6 55,112.1 52,112.1
  pour Top (no thermals): 7,34.1 8.5,35.6 40,35.6 40,12.1 34,6.1 31,6.1 8.5,29.6 7,31.1
  pour Bottom (no thermals): 70.5,112.6 71,113.1 75.5,113.1 76,112.6 76,110.1 75.25,109.35 71.25,109.35 70.5,110.1
VBATT  (via drill 0.35, 0.38)
  Top 0.2: R9.1 R10.1 | C29.1 30.4,67.05 C19.1 30.4,63.65 v29.92,63.17 C27.1 C28.1 28.85,58.45 27.62,57.22 U3.13 U3.14 | R12.1 R11.1 | v60.9,130.2 59.8,131.3 59.5,131.3
  Top 0.254: U1.16 113.25,92.25 C1.1
  Top 0.61: v109.5,97.1 109.5,93.6 | 20.6,37.8 v10,37.8 | v10,47.35 v10,50.6
  Bottom 0.2: C18.1 29.45,62.7 v29.92,63.17 | R34.2 62.35,130.2 v60.9,130.2 | U2.1 99.54,129.45 99.69,129.3
  Bottom 0.61: v109.5,97.1 109.5,117.75 99.69,127.56 | 11.5,58.1 2.1,67.5 2.1,89.1 | 2.1,89.1 2.1,114.7 3.42,116.02 9.48,116.02 v11.6,113.9 | C26.2 12.6,87.05 D21.A 2.1,89.1 | 11.5,58.1 23.4,58.1 C18.1 | 11.5,58.1 10,56.6 v10,50.6 | v10,47.35 v10,37.8 | 99.69,127.56 99.69,129.3 99.69,136.66 95.41,140.94 62.14,140.94 45.99,124.79 C11.+ | U2.3 99.68,127.55 99.69,127.56
  pour Top (no thermals): 9.5,106.1 9.5,112.1 11.5,114.1 19,114.1 28,123.1 33.5,123.1 38.6,128.2 50.1,128.2 58,136.1 60,136.1 60.5,135.6 60.5,131.3 50.9,121.7 39.98,121.7 35.88,117.6 32,117.6 24.5,110.1 24.5,106.1
  pour Top (no thermals): 20,45.1 32,45.1 32,37.6 29.5,37.6 29.5,43.1 22.5,43.1 22.5,37.6 20,37.6 20,39.6
  pour Top (no thermals): 32.4,134.4 38.6,128.2 37.1,126.7 30.9,132.9
  pour Top (no thermals): 109.25,94.1 114.88,94.1 114.88,91.85 113,91.85 113,92.72 109.88,92.72 109.25,93.35
  pour Bottom (no thermals): 97.7,132 97.7,129.1 99.9,129.1 99.9,132
VMON  (via drill 0.35)
  Top 0.2: R48.2 R47.1 125,42.55 v125,40.6 | v140,89.1 139.5,89.1 138.25,87.85 138.25,87.35 138,87.1 135.9,87.1 U4.31
  Bottom 0.2: v125,40.6 140.5,56.1 140.5,88.6 v140,89.1
VSN  (via drill 0.38)
  Top 0.152: Q2.2 16.96,61.6 20.96,61.6 22.45,61.6 R15.1
  Top 0.2: R16.1 R15.1
  other vias: 20,74.1 21,74.1 22,74.1 21.5,75.1 20.5,75.1
  pour Top (no thermals): 10,57.1 10,79.1 24,79.1 24,75.1 22.5,73.6 20.5,73.6 18,71.6 18,67.6 21,64.6 21,57.1
  pour Bottom (no thermals): 19.25,78.35 20.75,78.35 22.5,76.6 22.5,73.85 22.25,73.6 19.88,73.6 19.75,73.6 19.5,73.85 19.25,74.1

## Text on the board
tPlace: CHG LEVEL | CHARGE | 30/50A | FAULT | LT3751 | AUTO / DSCHG | BALL | MISO | MOSI | SCK | !CS! | DBG | !RESET | GND | + | NC | HV AC | J2 PINOUT | NC | HIGH VOLTAGE | HIGH VOLTAGE | MCU STATUS | ID | Kicker v3.1 | 15V | PWR | HIGH VOLTAGE | 5V | CHIP | KICK | HIGH VOLTAGE | CHARGE | RoboJackets 2019.2 | HIGH VOLTAGE | HIGH VOLTAGE | - | -
bPlace: > | > | W. Stuckey: wstuckey3@gatech.edu / D. Yang: dyang316@gatech.edu
tDocu: x
bDocu: -